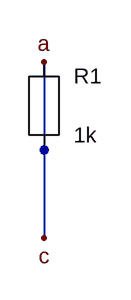
[diagram p0: schematic same_instance_run_past_second_pin.asc]
same_instance_run_past_second_pin.asc, the LTspice schematic file:
Version 4
SHEET 1 880 680
WIRE 96 96 96 288
SYMBOL res 96 144 R0
SYMATTR InstName R1
SYMATTR Value 1k
FLAG 96 96 a
FLAG 96 288 c

The netlist it stands for:
* same_instance_run_past_second_pin.asc
R1 c c 1k
.backanno
.end